# Altium schematic sheet 05_SYS_Power.SchDoc
size 563 x 304 mm; DsnPath: C:\Users\nilot\Documents\VSCode\SBC\imports\SG2002_QFN88_38_20230301_4L_V1.3_16.2.DSN; SchematicName: CV181xC_QFN88_38_DemoBoard; PageName: 05_SYS_Power; PageSize: Custom; TopSchematic: True
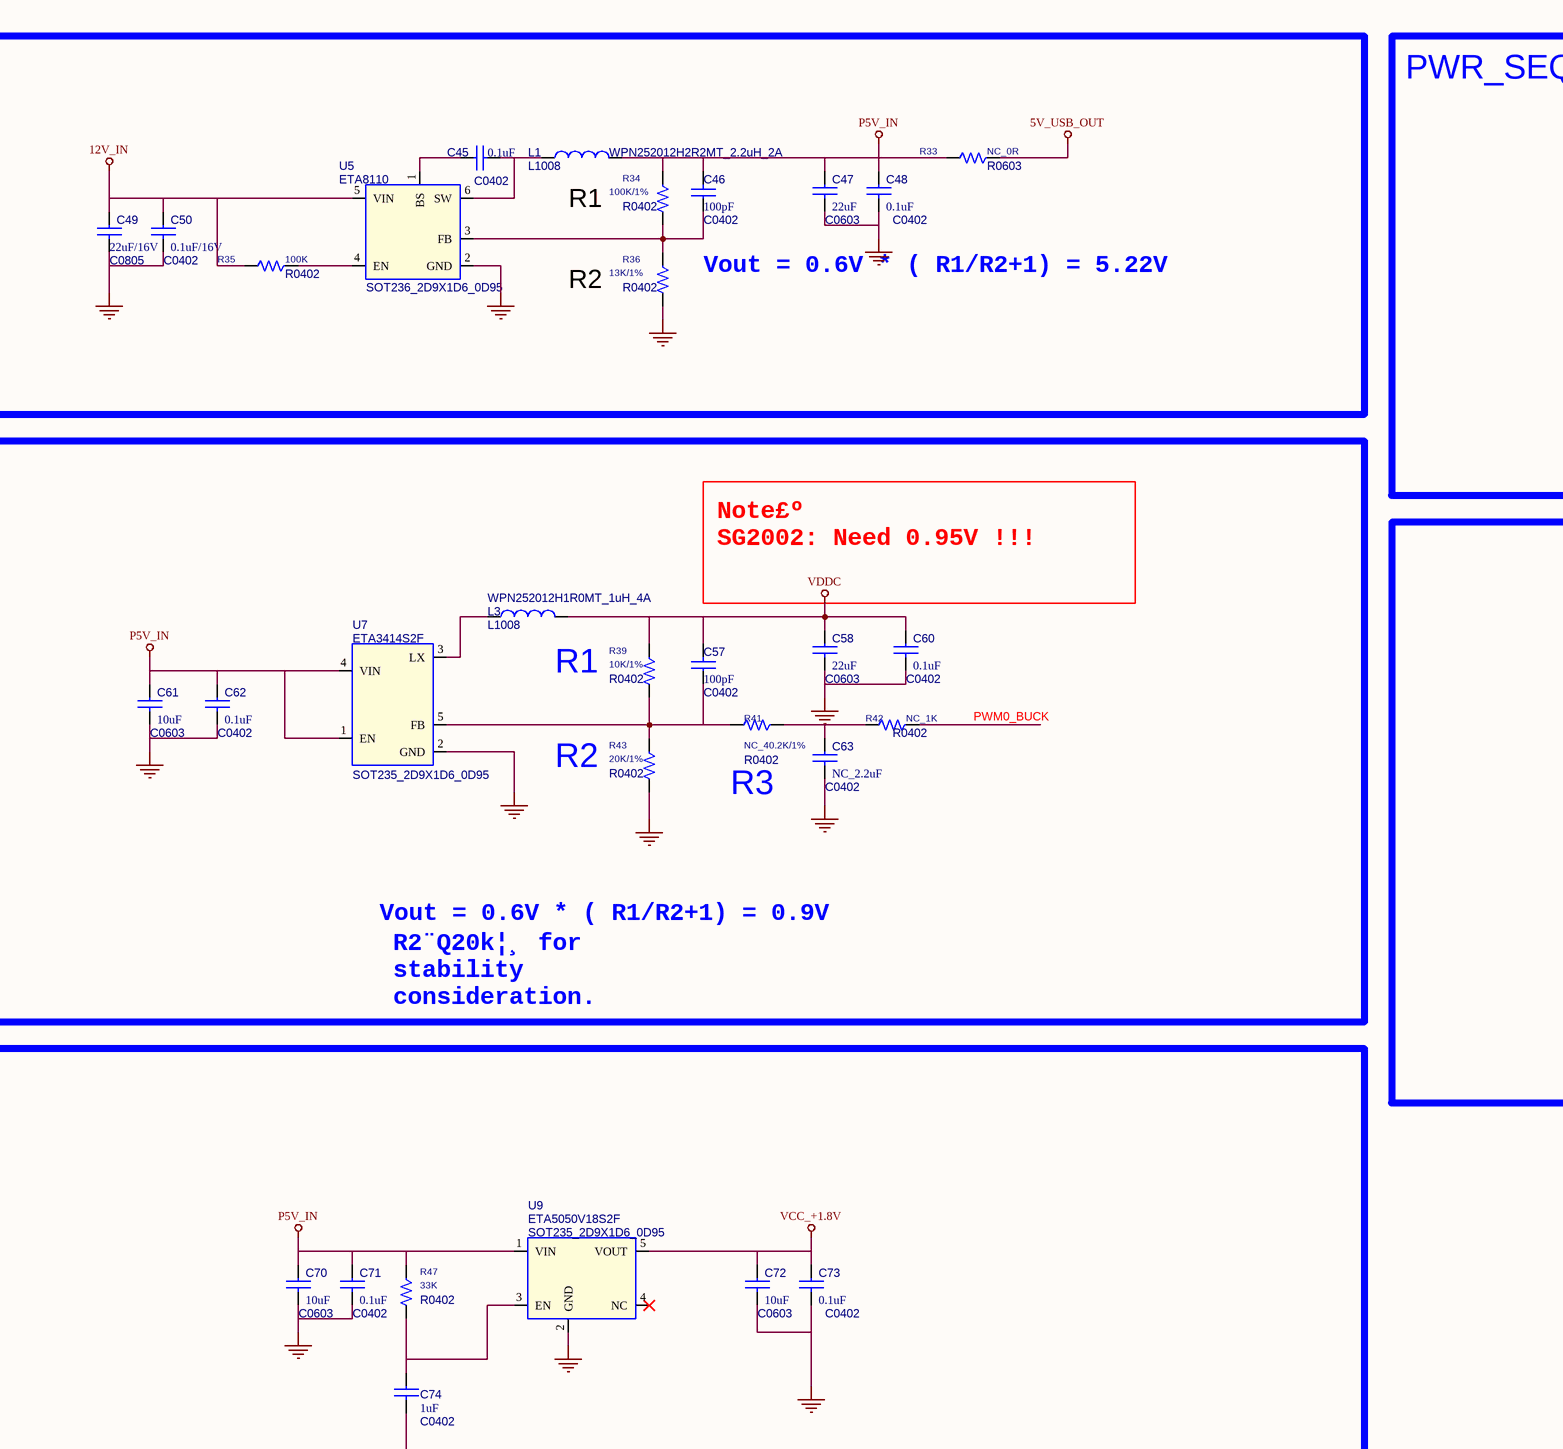
[diagram p0: 05_SYS_Power.SchDoc, top left]
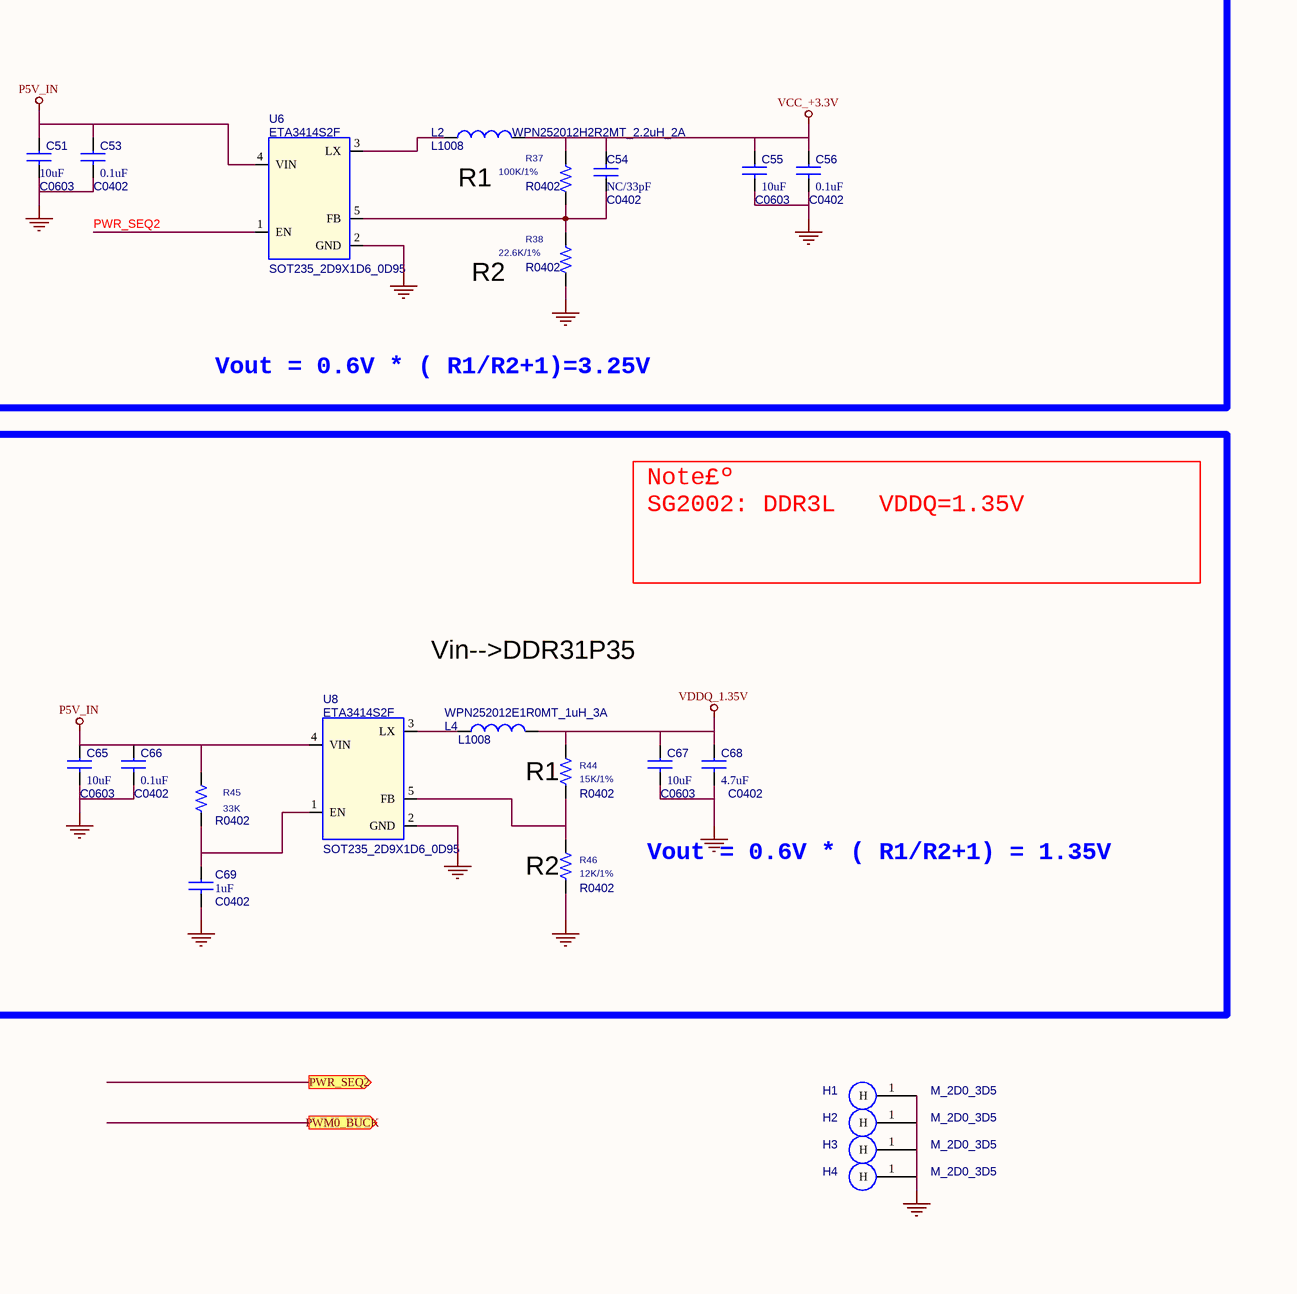
[diagram p1: 05_SYS_Power.SchDoc, top middle]
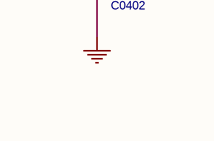
[diagram p2: 05_SYS_Power.SchDoc, centre left]
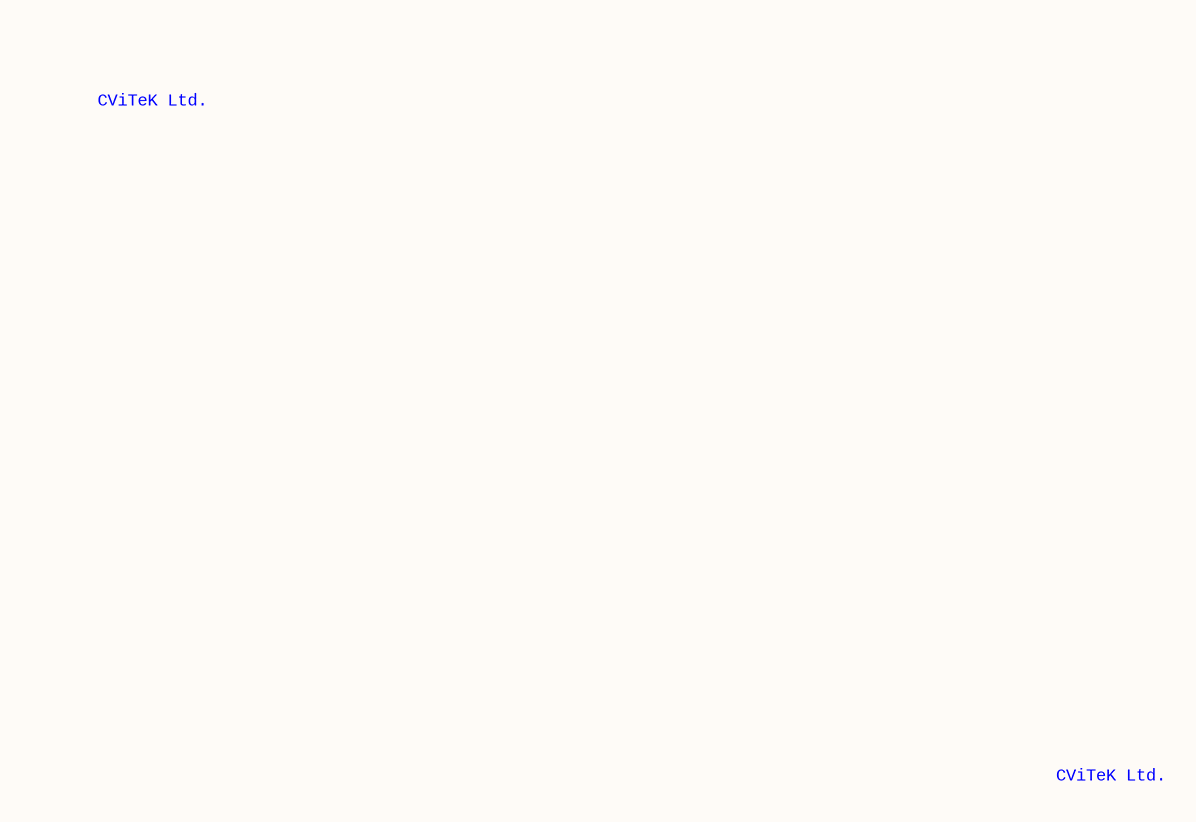
[diagram p3: 05_SYS_Power.SchDoc, bottom right]

## Parts
C45  0.1uF  [C0402]
C46  100pF  [C0402]
C47  22uF  [C0603]
C48  0.1uF  [C0402]
C49  22uF/16V  [C0805]
C50  0.1uF/16V  [C0402]
C51  10uF  [C0603]
C53  0.1uF  [C0402]
C54  NC/33pF  [C0402]
C55  10uF  [C0603]
C56  0.1uF  [C0402]
C57  100pF  [C0402]
C58  22uF  [C0603]
C60  0.1uF  [C0402]
C61  10uF  [C0603]
C62  0.1uF  [C0402]
C63  NC_2.2uF  [C0402]
C65  10uF  [C0603]
C66  0.1uF  [C0402]
C67  10uF  [C0603]
C68  4.7uF  [C0402]
C69  1uF  [C0402]
C70  10uF  [C0603]
C71  0.1uF  [C0402]
C72  10uF  [C0603]
C73  0.1uF  [C0402]
C74  1uF  [C0402]
H1  PCB Footprint: M_2D0_3D5  [M3_5.5X7.0_3.5]  (hidden comment: H1)
H2  PCB Footprint: M_2D0_3D5  [M3_5.5X7.0_3.5]  (hidden comment: H1)
H3  PCB Footprint: M_2D0_3D5  [M3_5.5X7.0_3.5]  (hidden comment: H1)
H4  PCB Footprint: M_2D0_3D5  [M3_5.5X7.0_3.5]  (hidden comment: H1)
L1  WPN252012H2R2MT_2.2uH_2A  PCB Footprint: L1008  [DISC/.350x.175/LS.200x.100/.034]
L2  WPN252012H2R2MT_2.2uH_2A  PCB Footprint: L1008  [DISC/.350x.175/LS.200x.100/.034]
L3  WPN252012H1R0MT_1uH_4A  PCB Footprint: L1008  [DISC/.350x.175/LS.200x.100/.034]
L4  WPN252012E1R0MT_1uH_3A  PCB Footprint: L1008  [DISC/.350x.175/LS.200x.100/.034]
R33  NC_0R  [R0603]
R34  100K/1%  [R0402]
R35  100K  [R0402]
R36  13K/1%  [R0402]
R37  100K/1%  [R0402]
R38  22.6K/1%  [R0402]
R39  10K/1%  [R0402]
R41  NC_40.2K/1%  [R0402]
R42  NC_1K  [R0402]
R43  20K/1%  [R0402]
R44  15K/1%  [R0402]
R45  33K  [R0402]
R46  12K/1%  [R0402]
R47  33K  [R0402]
U5  ETA8110  [SOT236_2D9X1D6_0D95]
U6  ETA3414S2F  [SOT235_2D9X1D6_0D95]
U7  ETA3414S2F  [SOT235_2D9X1D6_0D95]
U8  ETA3414S2F  [SOT235_2D9X1D6_0D95]
U9  ETA5050V18S2F  [SOT235_2D9X1D6_0D95]

## Blocks framed on the sheet
PWR_SEQ02: C51 C53-C56 L2 R37 R38 U6

## Ports
PWM0_BUCK (out), PWR_SEQ2 (out)

## Nets
5V_USB_OUT: R33.1
12V_IN: C49.1 C50.1 R35.2 U5.5(VIN)
GND: C47.2 C48.2 C49.2 C50.2 C51.2 C53.2 C55.2 C56.2 C58.2 C60.2 C61.2 C62.2 C63.2 C65.2 C66.2 C67.2 C68.2 C69.2 C70.2 C71.2 C72.2 C73.2 C74.2 H1.1(H) H2.1(H) H3.1(H) H4.1(H) R36.2 R38.2 R43.2 R46.1 U5.2(GND) U6.2(GND) U7.2(GND) U8.2(GND) U9.2(GND)
P5V_IN: C46.2 C47.1 C48.1 C51.1 C53.1 C61.1 C62.1 C65.1 C66.1 C70.1 C71.1 L1.2 R33.2 R34.1 R45.2 R47.1 U6.4(VIN) U7.1(EN) U7.4(VIN) U8.4(VIN) U9.1(VIN)
VCC_+1.8V: C72.1 C73.1 U9.5(VOUT)
VCC_+3.3V: C54.2 C55.1 C56.1 L2.2 R37.1
VDDC: C57.2 C58.1 C60.1 L3.2 R39.1
VDDQ_1.35V: C67.1 C68.1 L4.2 R44.2
PWM0_BUCK: R42.1
PWR_SEQ2: U6.1(EN)
NetC45_1: C45.1 U5.1(BS)
NetC45_2: C45.2 L1.1 U5.6(SW)
NetC46_1: C46.1 R34.2 R36.1 U5.3(FB)
NetC54_1: C54.1 R37.2 R38.1 U6.5(FB)
NetC57_1: C57.1 R39.2 R41.2 R43.1 U7.5(FB)
NetC63_1: C63.1 R41.1 R42.2
NetC69_1: C69.1 R45.1 U8.1(EN)
NetC74_1: C74.1 R47.2 U9.3(EN)
NetL2_1: L2.1 U6.3(LX)
NetL3_1: L3.1 U7.3(LX)
NetL4_1: L4.1 U8.3(LX)
NetR35_1: R35.1 U5.4(EN)
NetR44_1: R44.1 R46.2 U8.5(FB)

Not connected (* = marked no-connect by the designer): U9 4(NC)*

## Notes on the sheet
- (near L1) R1
- R2
- Vout = 0.6V * ( R1/R2+1) = 5.22V
- (near L2) R1
- Note£º
  SG2002: Need 0.95V !!!
- Vout = 0.6V * ( R1/R2+1)=3.25V
- Note£º
  SG2002: DDR3L   VDDQ=1.35V
- (near L3) R1
- Vin-->DDR31P35
- R3
- (near R44) R1
- Vout = 0.6V * ( R1/R2+1) = 0.9V
- R2¨Q20k¦¸ for
  stability
  consideration.
- (near R46) R2
- Vout = 0.6V * ( R1/R2+1) = 1.35V
- CViTeK Ltd.

## Library data of the parts
C45 = C: C0402; Part Name: sC0402; Part Number: GRM155R61E104KA87D; Part Reference: C45; Cloud IC Number: Y02110431K00; Vendor: murata; Value: 0.1uF; PCB Footprint: C0402
C46 = C: C0402; Part Name: sC0402; Part Number: GRM155R61E104KA87D; Part Reference: C46; Cloud IC Number: Y02110431K00; Vendor: murata; Value: 100pF; PCB Footprint: C0402
C47 = C: C0603; Part Number: GRM155R61E104KA87D; Part Reference: C47; Cloud IC Number: Y02110431K00; Vendor: murata; Part Name: C0603; Value: 22uF; PCB Footprint: C0603
C48 = C: C0402; Part Number: GRM155R61E104KA87D; Part Reference: C48; Cloud IC Number: Y02110431K00; Vendor: murata; Part Name: C0402; Value: 0.1uF; PCB Footprint: C0402
C49 = C: C0805; Part Number: GRM155R61E104KA87D; Part Reference: C49; Cloud IC Number: Y02110431K00; Vendor: murata; Part Name: C0805; Value: 22uF/16V; PCB Footprint: C0805
C50 = C: C0402; Part Number: GRM155R61E104KA87D; Part Reference: C50; Cloud IC Number: Y02110431K00; Vendor: murata; Part Name: C0402; Value: 0.1uF/16V; PCB Footprint: C0402
C51 = C: C0805; Part Number: GRM155R61E104KA87D; Part Reference: C51; Cloud IC Number: Y02110431K00; Vendor: murata; Part Name: C0805; Value: 10uF; PCB Footprint: C0603
C53 = C: C0402; Part Number: GRM155R61E104KA87D; Part Reference: C53; Cloud IC Number: Y02110431K00; Vendor: murata; Part Name: C0402; Value: 0.1uF; PCB Footprint: C0402
C54 = C: C0402; Part Name: sC0402; Part Number: GRM155R61E104KA87D; Part Reference: C54; Cloud IC Number: Y02110431K00; Vendor: murata; Value: NC/33pF; PCB Footprint: C0402
C55 = C: C0603; Part Number: GRM155R61E104KA87D; Part Reference: C55; Cloud IC Number: Y02110431K00; Vendor: murata; Part Name: C0603; Value: 10uF; PCB Footprint: C0603
C56 = C: C0402; Part Number: GRM155R61E104KA87D; Part Reference: C56; Cloud IC Number: Y02110431K00; Vendor: murata; Part Name: C0402; Value: 0.1uF; PCB Footprint: C0402
C57 = C: C0402; Part Name: sC0402; Part Number: GRM155R61E104KA87D; Part Reference: C57; Cloud IC Number: Y02110431K00; Vendor: murata; Value: 100pF; PCB Footprint: C0402
C58 = C: C0805; Part Number: GRM155R61E104KA87D; Part Reference: C58; Cloud IC Number: Y02110431K00; Vendor: murata; Part Name: C0805; Value: 22uF; PCB Footprint: C0603
C60 = C: C0402; Part Number: GRM155R61E104KA87D; Part Reference: C60; Cloud IC Number: Y02110431K00; Vendor: murata; Part Name: C0402; Value: 0.1uF; PCB Footprint: C0402
C61 = C: C0603; Part Number: GRM155R61E104KA87D; Part Reference: C61; Cloud IC Number: Y02110431K00; Vendor: murata; Part Name: C0603; Value: 10uF; PCB Footprint: C0603
C62 = C: C0402; Part Number: GRM155R61E104KA87D; Part Reference: C62; Cloud IC Number: Y02110431K00; Vendor: murata; Part Name: C0402; Value: 0.1uF; PCB Footprint: C0402
C63 = C: C0402; Part Number: GRM155R61E104KA87D; Part Reference: C63; Cloud IC Number: Y02110431K00; Vendor: murata; Part Name: C0402; Value: NC_2.2uF; PCB Footprint: C0402
C65 = C: C0603; Part Number: GRM155R61E104KA87D; Part Reference: C65; Cloud IC Number: Y02110431K00; Vendor: murata; Part Name: C0603; Value: 10uF; PCB Footprint: C0603
C66 = C: C0402; Part Number: GRM155R61E104KA87D; Part Reference: C66; Cloud IC Number: Y02110431K00; Vendor: murata; Part Name: C0402; Value: 0.1uF; PCB Footprint: C0402
C67 = C: C0603; Part Number: GRM155R61E104KA87D; Part Reference: C67; Cloud IC Number: Y02110431K00; Vendor: murata; Part Name: C0603; Value: 10uF; PCB Footprint: C0603
C68 = C: C0402; Part Number: GRM155R61E104KA87D; Part Reference: C68; Cloud IC Number: Y02110431K00; Vendor: murata; Part Name: C0402; Value: 4.7uF; PCB Footprint: C0402
C69 = C: C0402; Part Number: GRM155R61E104KA87D; Part Reference: C69; Cloud IC Number: Y02110431K00; Vendor: murata; Part Name: C0402; Value: 1uF; PCB Footprint: C0402
C70 = C: C0603; Part Number: GRM155R61E104KA87D; Part Reference: C70; Cloud IC Number: Y02110431K00; Vendor: murata; Part Name: C0603; Value: 10uF; PCB Footprint: C0603
C71 = C: C0402; Part Number: GRM155R61E104KA87D; Part Reference: C71; Cloud IC Number: Y02110431K00; Vendor: murata; Part Name: C0402; Value: 0.1uF; PCB Footprint: C0402
C72 = C: C0603; Part Number: GRM155R61E104KA87D; Part Reference: C72; Cloud IC Number: Y02110431K00; Vendor: murata; Part Name: C0603; Value: 10uF; PCB Footprint: C0603
C73 = C: C0402; Part Number: GRM155R61E104KA87D; Part Reference: C73; Cloud IC Number: Y02110431K00; Vendor: murata; Part Name: C0402; Value: 0.1uF; PCB Footprint: C0402
C74 = C: C0402; Part Number: GRM155R61E104KA87D; Part Reference: C74; Cloud IC Number: Y02110431K00; Vendor: murata; Part Name: C0402; Value: 1uF; PCB Footprint: C0402
H1 = H: Part Reference: H1; Value: H1; Part Type: NC
H2 = H: Part Reference: H2; Value: H1; Part Type: NC
H3 = H: Part Reference: H3; Value: H1; Part Type: NC
H4 = H: Part Reference: H4; Value: H1; Part Type: NC
L1 = L: Part Reference: L1; Part Number: 20500109; DIST: FLAT; PSpiceTemplate: L^@REFDES %1 %2 ?TOLERANCE|L^@REFDES| @VALUE ?IC/IC=@IC/ ?TOLERANCE|\n.model l^@REFDES IND L=1 DEV=@TOLERANCE%|; CURRENT: LMAX; DIELECTRIC: DSMAX; Value: WPN252012H2R2MT_2.2uH_2A
L2 = L: Part Reference: L2; Part Number: 20500109; DIST: FLAT; PSpiceTemplate: L^@REFDES %1 %2 ?TOLERANCE|L^@REFDES| @VALUE ?IC/IC=@IC/ ?TOLERANCE|\n.model l^@REFDES IND L=1 DEV=@TOLERANCE%|; CURRENT: LMAX; DIELECTRIC: DSMAX; Value: WPN252012H2R2MT_2.2uH_2A
L3 = L: Part Reference: L3; Part Number: 20500109; DIST: FLAT; PSpiceTemplate: L^@REFDES %1 %2 ?TOLERANCE|L^@REFDES| @VALUE ?IC/IC=@IC/ ?TOLERANCE|\n.model l^@REFDES IND L=1 DEV=@TOLERANCE%|; CURRENT: LMAX; DIELECTRIC: DSMAX; Value: WPN252012H1R0MT_1uH_4A
L4 = L: Part Reference: L4; Part Number: 20500109; DIST: FLAT; PSpiceTemplate: L^@REFDES %1 %2 ?TOLERANCE|L^@REFDES| @VALUE ?IC/IC=@IC/ ?TOLERANCE|\n.model l^@REFDES IND L=1 DEV=@TOLERANCE%|; CURRENT: LMAX; DIELECTRIC: DSMAX; Value: WPN252012E1R0MT_1uH_3A
R33 = R_Dup2: Part Reference: R33; Value: NC_0R; PCB Footprint: R0603
R34 = R_Dup2: Part Reference: R34; Value: 100K/1%; PCB Footprint: R0402
R35 = R_Dup2: Part Reference: R35; Value: 100K; PCB Footprint: R0402
R36 = R_Dup2: Part Reference: R36; Value: 13K/1%; PCB Footprint: R0402
R37 = R_Dup2: Part Reference: R37; Value: 100K/1%; PCB Footprint: R0402
R38 = R_Dup2: Part Reference: R38; Value: 22.6K/1%; PCB Footprint: R0402
R39 = R_Dup2: Part Reference: R39; Value: 10K/1%; PCB Footprint: R0402
R41 = R_Dup1: R0402; Part Reference: R41; Value: NC_40.2K/1%; PCB Footprint: R0402
R42 = R_Dup1: R1206; Part Reference: R42; Value: NC_1K; PCB Footprint: R0402; Part Name: R1206
R43 = R_Dup2: Part Reference: R43; Value: 20K/1%; PCB Footprint: R0402
R44 = R_Dup1: R0402; Part Reference: R44; Value: 15K/1%; PCB Footprint: R0402
R45 = R_Dup1: R0402; Part Reference: R45; Value: 33K; PCB Footprint: R0402
R46 = R_Dup1: R0402; Part Reference: R46; Value: 12K/1%; PCB Footprint: R0402
R47 = R_Dup2: Part Reference: R47; Value: 33K; PCB Footprint: R0402
U5 = G2832TB1U_0: Part Reference: U5; Value: ETA8110; PCB Footprint: SOT236_2D9X1D6_0D95
U6 = G2822T11U_0: Part Reference: U6; Value: ETA3414S2F; PCB Footprint: SOT235_2D9X1D6_0D95
U7 = G2822T11U_0: Part Reference: U7; Value: ETA3414S2F; PCB Footprint: SOT235_2D9X1D6_0D95
U8 = G2822T11U_0: Part Reference: U8; Value: ETA3414S2F; PCB Footprint: SOT235_2D9X1D6_0D95
U9 = G9091-180T11U: Part Reference: U9; Value: ETA5050V18S2F; PCB Footprint: SOT235_2D9X1D6_0D95